# Altium project Project power supply.PrjPCB
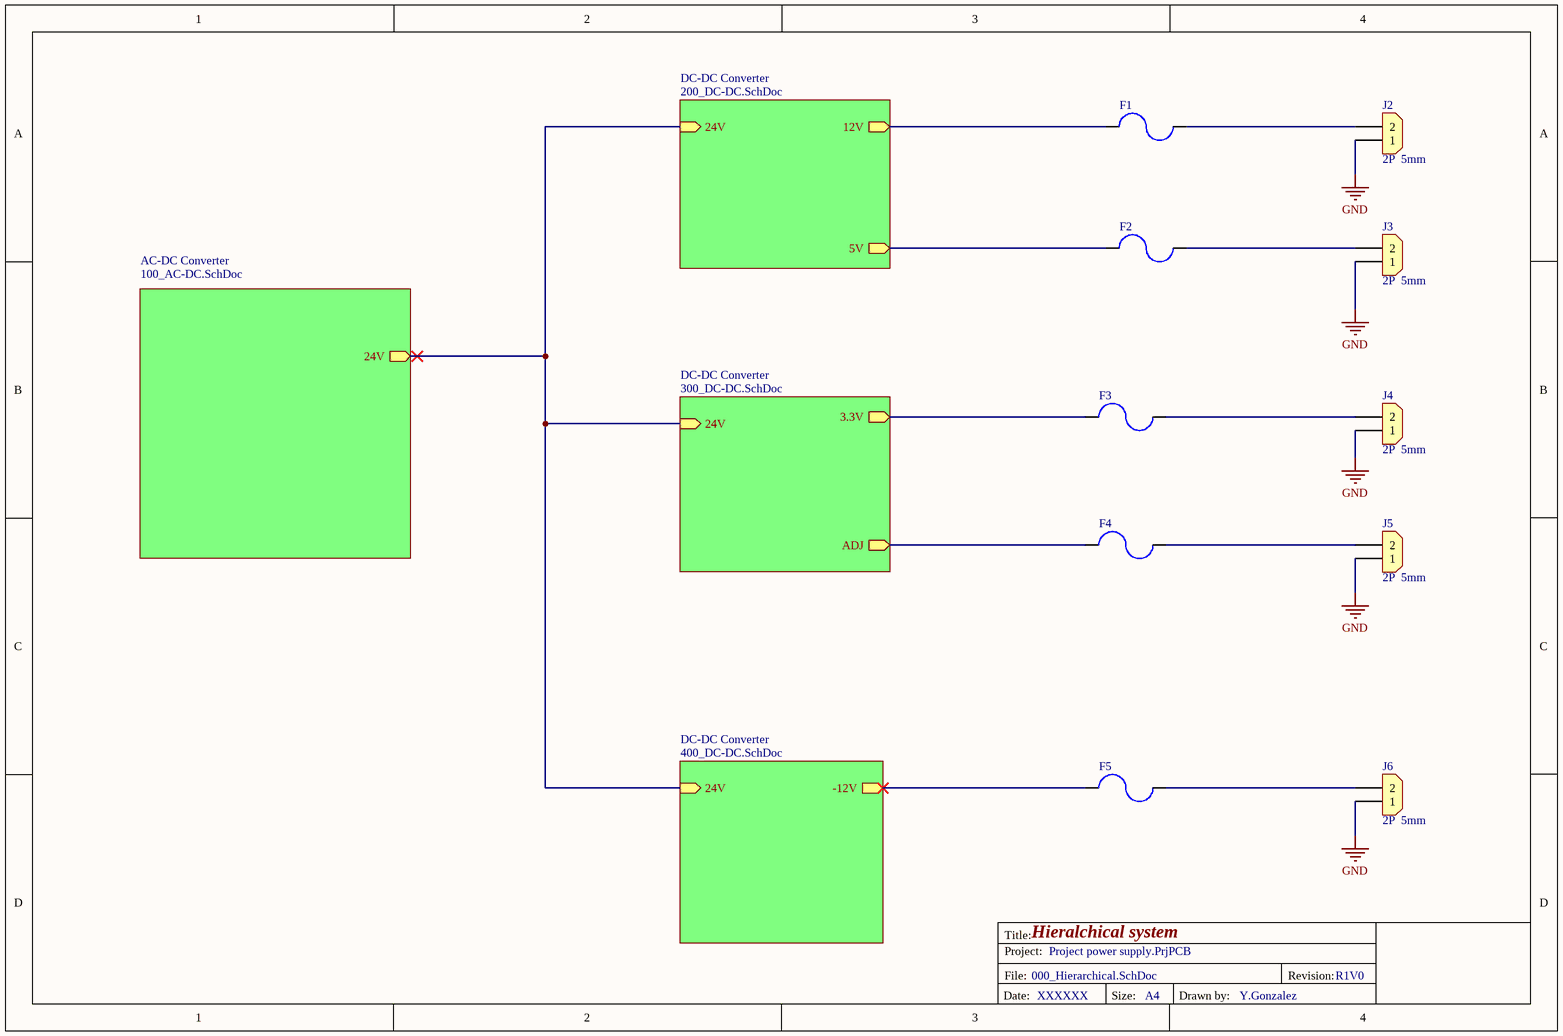
[diagram p0: 000_Hierarchical.SchDoc]
GlobalBoardName: boardname; GlobalDrawnBy: drawnby; GlobalFactory: pcbfactory; GlobalProjectName: projectname; GlobalReleaseDate: yyyymmdd; GlobalRevision: r; GlobalTPN: xxxxxx; GlobalVersion: v
5 sheets, 72 parts. Net scope: hierarchical (ports join the sheet entries above them; power ports are global).
Board file: Main_PCB_V1R0_XXXXXX.PcbDoc
Sheets:
  000_Hierarchical.SchDoc
    AC-DC Converter = 100_AC-DC.SchDoc
    DC-DC Converter = 200_DC-DC.SchDoc
    DC-DC Converter = 300_DC-DC.SchDoc
    DC-DC Converter = 400_DC-DC.SchDoc

## Sheet 000_Hierarchical.SchDoc: Hieralchical system
size A4; Date: XXXXXX; DrawnBy: Y.Gonzalez; Revision: R1V0; SheetNumber: 1; SheetTotal: 5

### Parts
F1  16V 5A  [FUSE_RADIAL_14.20X10.00X2.50mm]  (value not drawn)
F2  16V 5A  [FUSE_RADIAL_14.20X10.00X2.50mm]  (value not drawn)
F3  16V 4A  [FUSE_RADIAL_12.80X8.40X2.50mm]  (value not drawn)
F4  16V 4A  [FUSE_RADIAL_12.80X8.40X2.50mm]  (value not drawn)
F5  16V 1.6A  [1812]  (value not drawn)
J2  2P  5mm  [CON_2x1_TH_5mm]
J3  2P  5mm  [CON_2x1_TH_5mm]
J4  2P  5mm  [CON_2x1_TH_5mm]
J5  2P  5mm  [CON_2x1_TH_5mm]
J6  2P  5mm  [CON_2x1_TH_5mm]

### Sub-sheets
AC-DC Converter = 100_AC-DC.SchDoc: 24V (out)
DC-DC Converter = 200_DC-DC.SchDoc: 24V (in), 12V (out), 5V (out)
DC-DC Converter = 300_DC-DC.SchDoc: 24V (in), 3.3V (out), ADJ (out)
DC-DC Converter = 400_DC-DC.SchDoc: 24V (in), -12V (out)

### Nets
GND: J2.1 J3.1 J4.1 J5.1 J6.1
Net12V_1: F1.1 ; sheet DC-DC Converter/12V
Net24V_1: sheet AC-DC Converter/24V, sheet DC-DC Converter/24V, sheet DC-DC Converter/24V, sheet DC-DC Converter/24V
NetC11_1: F2.1 ; sheet DC-DC Converter/5V
NetC16_1: F3.1 ; sheet DC-DC Converter/3.3V
NetC20_1: F4.1 ; sheet DC-DC Converter/ADJ
NetC26_2: F5.1 ; sheet DC-DC Converter/-12V
NetF1_2: F1.2 J2.2
NetF2_2: F2.2 J3.2
NetF3_2: F3.2 J4.2
NetF4_2: F4.2 J5.2
NetF5_2: F5.2 J6.2

### Notes on the sheet
- Title:
- Project:
- File:
- Revision:
- Date:
- Size:
- A4
- Drawn by:

### Library data of the parts
F1 F2 = F_5A_16V_PTC: PTC RESET FUSE 16V 5A RADIAL; Manufacturer: Littelfuse Inc.; Manufacturer Part Number: RGEF500; Reel Sotck: N/A; Last modified by: J.Jaramillo; Last modified date: 20240309; Supplier 1: Digi-Key; Supplier Part Number 1: RGEF500HF-ND; ComponentLink1Description: Digi-key; ComponentLink1URL: https://www.digikey.com/product-detail/en/littelfuse-inc/RGEF500/RGEF500HF-ND/5029781
F3 F4 = F_4A_16V_PTC: PTC RESET FUSE 16V 4A RADIAL; Manufacturer: Littelfuse Inc.; Manufacturer Part Number: RGEF400; Reel Sotck: N/A; Last modified by: J.Jaramillo; Last modified date: 20240309; Supplier 1: Digi-Key; Supplier Part Number 1: RGEF400HF-ND; ComponentLink1Description: Digi-key; ComponentLink1URL: https://www.digikey.com/product-detail/en/littelfuse-inc/RGEF400/RGEF400HF-ND/5130245
F5 = F_1.6A_16V_PTC: PTC RESET FUSE 16V 1.6A 1812; Manufacturer: Bel Fuse Inc.; Manufacturer Part Number: 0ZCG0160BF2C; Supplier 1: Digi-Key; Supplier Part Number 1: 507-1776-1-ND; Reel Sotck: N/A; Last modified by: J.Jaramillo; Last modified date: 20240309; ComponentLink1Description: Digi-Key; ComponentLink1URL: https://www.digikey.com/product-detail/en/bel-fuse-inc/0ZCG0160BF2C/507-1776-1-ND/4156320
J2-J6 = Con_2x1_TH_5mm: TERM BLK 2POS SIDE ENTRY 5MM PCB; Manufacturer: Phoenix Contact; Manufacturer Part Number: 1935161; Supplier Part Number 1: 277-1667-ND; Last modified by: J.Jaramillo; Last modified date: 20240310; ComponentLink1Description: Digi-key; ComponentLink1URL: https://www.digikey.com/en/products/detail/phoenix-contact/1935161/568614; Reel Stock: N/A; Supplier 1: Digi-Key

## Sheet 100_AC-DC.SchDoc: AC-DC convertion stage
size A4; Date: XXXXXX; Author: Y.Gonzalez; Revision: R1V0; SheetNumber: 2; SheetTotal: 5
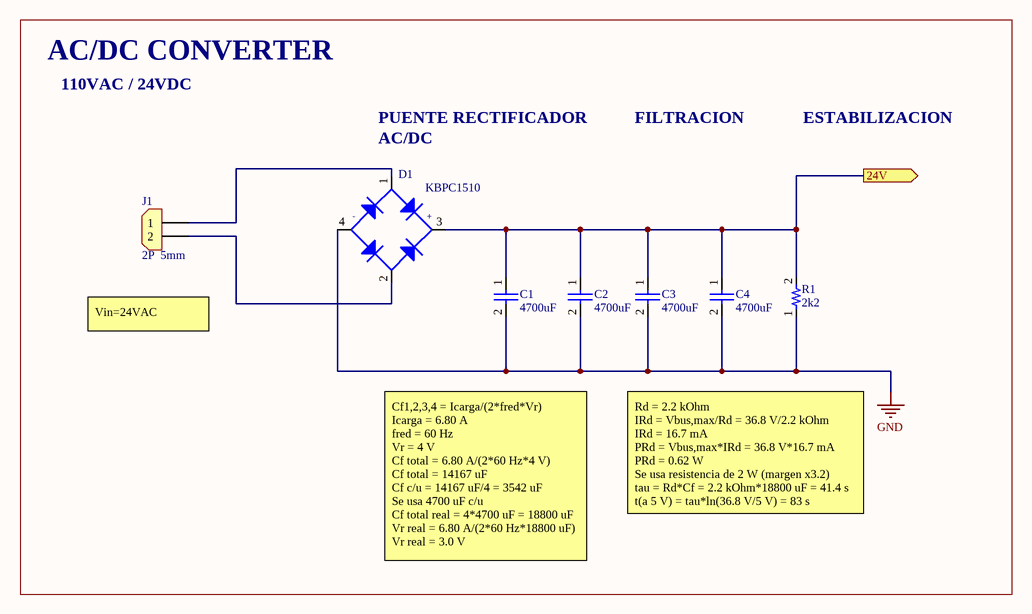
[diagram p1: 100_AC-DC.SchDoc]

### Parts
C1  value 4700uF  [CAP_4700uF_50V]  (hidden comment: 50USC4700MEFCSN22X35)
C2  value 4700uF  [CAP_4700uF_50V]  (hidden comment: 50USC4700MEFCSN22X35)
C3  value 4700uF  [CAP_4700uF_50V]  (hidden comment: 50USC4700MEFCSN22X35)
C4  value 4700uF  [CAP_4700uF_50V]  (hidden comment: 50USC4700MEFCSN22X35)
D1  KBPC1510  [KBPC8]
J1  2P  5mm  [CON_2x1_TH_5mm]
R1  value 2k2  [Res_2K2_2W_TH]

### Ports
24V (out)

### Nets
GND: C1.2 C2.2 C3.2 C4.2 D1.4 R1.1
Net24V_1: C1.1 C2.1 C3.1 C4.1 D1.3 R1.2 ; port 24V
NetD1_1: D1.1 J1.1
NetD1_2: D1.2 J1.2

### Notes on the sheet
- AC/DC CONVERTER
- 110VAC / 24VDC
- PUENTE RECTIFICADOR
- (near D1) AC/DC
- FILTRACION
- ESTABILIZACION
- Vin=24VAC
- Cf1,2,3,4 = Icarga/(2*fred*Vr)
  Icarga = 6.80 A
  fred = 60 Hz
  Vr = 4 V
  Cf total = 6.80 A/(2*60 Hz*4 V)
  Cf total = 14167 uF
  Cf c/u = 14167 uF/4 = 3542 uF
  Se usa 4700 uF c/u
  Cf total real = 4*4700 uF = 18800 uF
  Vr real = 6.80 A/(2*60 Hz*18800 uF)
  Vr real = 3.0 V
- Rd = 2.2 kOhm
  IRd = Vbus,max/Rd = 36.8 V/2.2 kOhm
  IRd = 16.7 mA
  PRd = Vbus,max*IRd = 36.8 V*16.7 mA
  PRd = 0.62 W
  Se usa resistencia de 2 W (margen x3.2)
  tau = Rd*Cf = 2.2 kOhm*18800 uF = 41.4 s
  t(a 5 V) = tau*ln(36.8 V/5 V) = 83 s
- Title:
- Project:
- File:
- Revision:
- Date:
- Size:
- A4
- Drawn by:
- (in symbol BR_KBPC_1kV_15A) -; +

### Library data of the parts
C1-C4 = CAP_4700uF_50V: CAP ALUM 4700uF ±20% 50V TH; Manufacturer: Rubycon; Parameter 4: C338224; Manufacturer Part Number: 50USC4700MEFCSN22X35; Supplier 1: LCSC; Supplier Part Number 1: C338224; Last modified by: Y.Gonzalez; Last modified date: 24102026; ComponentLink1Description: datasheet; ComponentLink1URL: https://www.lcsc.com/datasheet/C338224.pdf; ComponentLink2Description: LCSC; ComponentLink2URL: https://www.lcsc.com/product-detail/C338224.html?s_z=n_q_t_4700%25C2%25B5F%2520%252050V
D1 = BR_KBPC_1kV_15A: BRIDGE RECT 1kV 15A KBPC; Manufacturer: YFW; Supplier 1: C19273102; Supplier Part Number 1: LCSC; Manufacturer Part Numbers: KBPC1510; Last modified by: Y.Gonzalez; Last modified date: 24102026; ComponentLink1Description: LCSC; ComponentLink1URL: https://www.lcsc.com/product-detail/C19273102.html?s_z=n_q_KBPC1510; ComponentLink2Description: DATASHEET; ComponentLink2URL: https://www.lcsc.com/datasheet/C19273102.pdf
J1 = Con_2x1_TH_5mm: as J2 on sheet 000_Hierarchical; Supplier Part Number 1: 277-1667-ND; Last modified by: J.Jaramillo; Last modified date: 20240310; ComponentLink1Description: Digi-key; ComponentLink1URL: https://www.digikey.com/en/products/detail/phoenix-contact/1935161/568614; Reel Stock: N/A; Supplier 1: Digi-Key
R1 = Res_2K2_2W_TH: RES 2.2kΩ ±5% 2W Through Hole,D4.5xL11mm; Manufacturer: SEI(Stackpole Electronics Inc.); Manucfacturer Part Number 1: RSMF2JT2K20; Supplier: LCSC; Last modified by: Y.Gonzalez; Supplier Part Number 1: C2584336; Parameter 6: *; ComponentLink1Description: Datasheet; ComponentLink1URL: https://datasheet.octopart.com/RSMF2JT2K20-Stackpole-Electronics-datasheet-170576583.pdf; ComponentLink2Description: Ultralibrarian; ComponentLink2URL: https://app.ultralibrarian.com/details/3be72d1d-bf55-11e9-ab3a-0a3560a4cccc/Stackpole-International/RSMF2JT2K20?uid=19230567&exports=41; Last modified date: 25102026

## Sheet 200_DC-DC.SchDoc: DC-DC Convertion stage
size A4; Date: XXXXXX; Author: Y.Gonzalez; Revision: R1V0; SheetNumber: 3; SheetTotal: 5
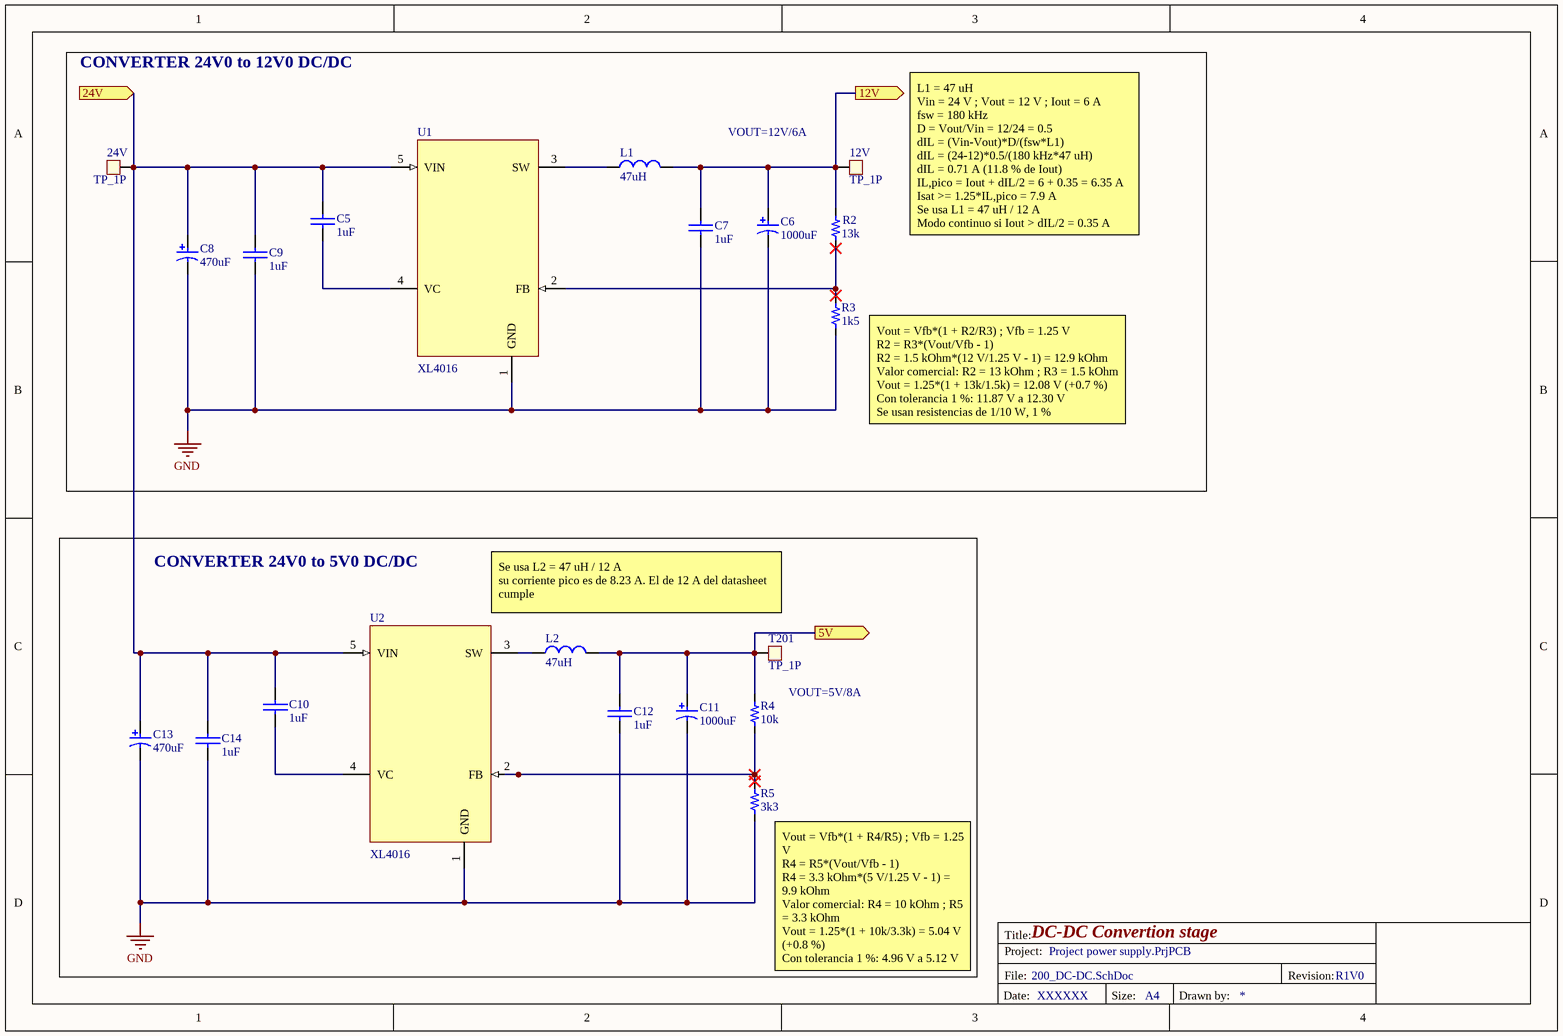
[diagram p2: 200_DC-DC.SchDoc]

### Parts
12V  TP_1P  [TP_TH_30mil]  (no BOM)
24V  TP_1P  [TP_TH_30mil]  (no BOM)
C5  value 1uF  [1206]  (hidden comment: 1uF 100V)
C6  value 1000uF  [RADIAL-CAN_LSx5mm_Diax10mm_Hx14mm]  (hidden comment: 1000uF 25V)
C7  value 1uF  [0805]  (hidden comment: 1uF 25V)
C8  value 470uF  [RADIAL-CAN-SMD_DIAX8MM_HX10MM]  (hidden comment: 470uF 10V)
C9  value 1uF  [1206]  (hidden comment: 1uF 100V)
C10  value 1uF  [1206]  (hidden comment: 1uF 100V)
C11  value 1000uF  [RADIAL-CAN_LSx5mm_Diax10mm_Hx14mm]  (hidden comment: 1000uF 25V)
C12  value 1uF  [0805]  (hidden comment: 1uF 25V)
C13  value 470uF  [RADIAL-CAN-SMD_DIAX8MM_HX10MM]  (hidden comment: 470uF 10V)
C14  value 1uF  [1206]  (hidden comment: 1uF 100V)
L1  value 47uH  [L_47uH_12A]  (hidden comment: FIXED IND 47UH 12A 12.2 MOHM SMD)
L2  value 47uH  [L_47uH_12A]  (hidden comment: FIXED IND 47UH 12A 12.2 MOHM SMD)
R2  value 13k  [0201]  (hidden comment: 13k 1/20W)
R3  value 1k5  [0402]  (hidden comment: 1k5 1/16W)
R4  value 10k  [0402]  (hidden comment: 10k 1/16W)
R5  value 3k3  [0402]  (hidden comment: 3k3 1/16W)
T201  TP_1P  [TP_TH_30mil]  (no BOM)
U1  XL4016  [TO-263-5]
U2  XL4016  [TO-263-5]

### Blocks framed on the sheet
CONVERTER 24V0 to 12V0 DC/DC: 12V 24V C5-C9 L1 R2 R3 U1
CONVERTER 24V0 to 5V0 DC/DC: C10-C14 L2 R4 R5 T201 U2

### Ports
5V (out), 12V (out), 24V (in)

### Nets
GND: C6.2 C7.2 C8.2 C9.2 C11.2 C12.2 C13.2 C14.2 R3.1 R5.1 U1.1(GND) U2.1(GND)
Net12V_1: 12V.1 C6.1 C7.1 L1.2 R2.2 ; port 12V
Net24V_1: 24V.1 C5.1 C8.1 C9.1 C10.1 C13.1 C14.1 U1.5(VIN) U2.5(VIN) ; port 24V
NetC5_2: C5.2 U1.4(VC)
NetC10_2: C10.2 U2.4(VC)
NetC11_1: C11.1 C12.1 L2.2 R4.2 T201.1 ; port 5V
NetL1_1: L1.1 U1.3(SW)
NetL2_1: L2.1 U2.3(SW)
NetR2_1: R2.1 R3.2 U1.2(FB)
NetR4_1: R4.1 R5.2 U2.2(FB)

### Notes on the sheet
- VOUT=12V/6A
- L1 = 47 uH
  Vin = 24 V ; Vout = 12 V ; Iout = 6 A
  fsw = 180 kHz
  D = Vout/Vin = 12/24 = 0.5
  dIL = (Vin-Vout)*D/(fsw*L1)
  dIL = (24-12)*0.5/(180 kHz*47 uH)
  dIL = 0.71 A (11.8 % de Iout)
  IL,pico = Iout + dIL/2 = 6 + 0.35 = 6.35 A
  Isat >= 1.25*IL,pico = 7.9 A
  Se usa L1 = 47 uH / 12 A
  Modo continuo si Iout > dIL/2 = 0.35 A
- (near R3) Vout = Vfb*(1 + R2/R3) ; Vfb = 1.25 V
  R2 = R3*(Vout/Vfb - 1)
  R2 = 1.5 kOhm*(12 V/1.25 V - 1) = 12.9 kOhm
  Valor comercial: R2 = 13 kOhm ; R3 = 1.5 kOhm
  Vout = 1.25*(1 + 13k/1.5k) = 12.08 V (+0.7 %)
  Con tolerancia 1 %: 11.87 V a 12.30 V
  Se usan resistencias de 1/10 W, 1 %
- Se usa L2 = 47 uH / 12 A
  su corriente pico es de 8.23 A. El de 12 A del datasheet cumple
- VOUT=5V/8A
- (near R5) Vout = Vfb*(1 + R4/R5) ; Vfb = 1.25 V
  R4 = R5*(Vout/Vfb - 1)
  R4 = 3.3 kOhm*(5 V/1.25 V - 1) = 9.9 kOhm
  Valor comercial: R4 = 10 kOhm ; R5 = 3.3 kOhm
  Vout = 1.25*(1 + 10k/3.3k) = 5.04 V (+0.8 %)
  Con tolerancia 1 %: 4.96 V a 5.12 V
  Se usan resistencias de 1/10 W, 1 %
- Title:
- Project:
- File:
- Revision:
- Date:
- Size:
- A4
- Drawn by:

### Library data of the parts
12V 24V T201 = TP_TH_30mil: Test point 30mil hole size; Last modified by: J.Jaramillo; Last modified date: 20240310
C5 C9 C10 C14 = Cap_1uF_1206_100V: CAP CER 1UF 100V X7R 1206; Manufacturer: Samsung Electro-Mechanics; Manufacturer Part Number: CL31B105KCHSNNE; Supplier 1: Digi-Key; Supplier Part Number 1: 1276-2747-1-ND; Last modified by: J.Jaramillo; Last modified date: 20240309; ComponentLink1Description: Digi-Key; ComponentLink1URL: https://www.digikey.com/en/products/detail/samsung-electro-mechanics/CL31B105KCHSNNE/3888405
C6 C11 = Cap_1000uF_25V_ALU_THT: CAP 1000uf/25V,10*16,105℃ RADIAL; Manufacturer: SamXon; Manufacturer Part Number: KM 1000U/25V; Last modified by: J.Jaramillo; Last modified date: 20240309; Supplier 1: Poshton; Supplier Part Number 1: KM 1000U/25V
C7 C12 = Cap_1uF_0805_25V: CAP CER 1UF 25V X7R 0805; Manufacturer: Yageo; Manufacturer Part Number: CC0805KKX7R8BB105; Supplier 1: Digi-Key; Supplier Part Number 1: 311-1456-1-ND; Last modified by: J.Jaramillo; Last modified date: 20240309; ComponentLink1Description: Digi-Key; ComponentLink1URL: https://www.digikey.com/product-detail/en/yageo/CC0805KKX7R8BB105/311-1456-1-ND/2833762
C8 C13 = Cap_470uF_10V_ALU_SMD: 470uF 10V ±20% SMD,D8xL10mm Aluminum Electrolytic Capacitors; Manufacturer: Lelon; Manufacturer Part Number: VZH471M1ATT-0810L; Supplier 1: LCSC; Supplier Part Number 1: C723180; Last modified by: J.Jaramillo; Last modified date: 20240309; ComponentLink1Description: LCSC; ComponentLink1URL: https://lcsc.com/product-detail/Aluminum-Electrolytic-Capacitors-SMD_Lelon-VZH471M1ATT-0810L_C723180.html
L1 L2 = L_47uH_12A: Manufacturer: Würth Elektronik; Manufacturer Part Number: 7443634700; Supplier 1: Digi-Key; Supplier Part Number 1: 732-2525-1-ND; Reel Stock: N/A; Last modified by: Y.Gonzalez; Last modified date: 23102026
R2 = Res_13k_0201_1/20W: RES SMD 13K OHM 1% 1/20W 0201; Manufacturer: YAGEO; Manufacturer Part Number: AC0201FR-0713KL; Supplier 1: DIGI-KEY; Supplier Part Number 1: YAG5154CT-ND; Reel Stock: N/A; Last modified by: J.Jaramillo; Last modified date: 20240310; ComponentLink1Description: Digi-Key; ComponentLink1URL: https://www.digikey.com/en/products/detail/yageo/AC0201FR-0713KL/5894273?s=N4IgTCBcDaIJoEEDiBWAjCgLAYQCoFoA5AERAF0BfIA
R3 = Res_1K5_0402_1/16W: RES SMD 1.5K OHM 5% 1/16W 0402; Manufacturer: Yageo; Manufacturer Part Number: RC0402JR-071K5L; Supplier 1: Digi-Key; Supplier Part Number 1: 311-1.5KJRCT-ND; Reel Stock: N/A; Last modified by: J.Jaramillo; Last modified date: 20240310; ComponentLink1Description: Link; ComponentLink1URL: https://www.digikey.com/product-detail/en/yageo/RC0402JR-071K5L/311-1-5KJRCT-ND/729359
R4 = Res_10k_0402_1/16W: RES SMD 10K OHM 1% 1/16W 0402; Manufacturer: Yageo; Manufacturer Part Number: RC0402FR-0710KL; Supplier 1: Digi-Key; Supplier Part Number 1: 311-10.0KLRCT-ND; Reel Stock: N/A; Last modified by: J.Jaramillo; Last modified date: 20240310; ComponentLink1Description: Digi-Key; ComponentLink1URL: https://www.digikey.com/en/products/detail/yageo/RC0402FR-0710KL/726523?s=N4IgTCBcDaIEoGEAMAWJYBicC0SDsAjEgNIAyIAugL5A
R5 = Res_3k3_0402_1/16W: RES SMD 3.3K OHM 5% 1/16W 0402; Manufacturer: Yageo; Manufacturer Part Number: RC0402JR-073K3L; Supplier 1: Digi-Key; Supplier Part Number 1: 311-3.3KJRCT-ND; Reel Stock: N/A; Last modified by: J.Jaramillo; Last modified date: 20240310; ComponentLink1Description: Digi-Key; ComponentLink1URL: https://www.digikey.com/product-detail/en/yageo/RC0402JR-073K3L/311-3-3KJRCT-ND/729403
U1 U2 = DCDC_ADJ_12A_TO-220-5L: 180 KHz fixed frequency PWM buck (step-down) DC/DC converter, capable of driving a 12A load with high efficiency; Manufacturer: XLSEMI; Manufacturer Part Number: XL4016; Supplier 1: LCSC; Supplier Part Number 1: C55881; Reel Stock: N/A; Last modified by: Y.Gonzalez; Last modified date: 22102026; ComponentLink1Description: LCSC; ComponentLink1URL: https://www.lcsc.com/product-detail/C55881.html; ComponentLink2Description: Datasheet; ComponentLink2URL: https://www.snapeda.com/parts/XL4016/XLSEMI/datasheet/

## Sheet 300_DC-DC.SchDoc: DC-DC Convertion stage
size A4; Date: XXXXXX; Author: Y.Gonzalez; Revision: R1V0; SheetNumber: 4; SheetTotal: 5
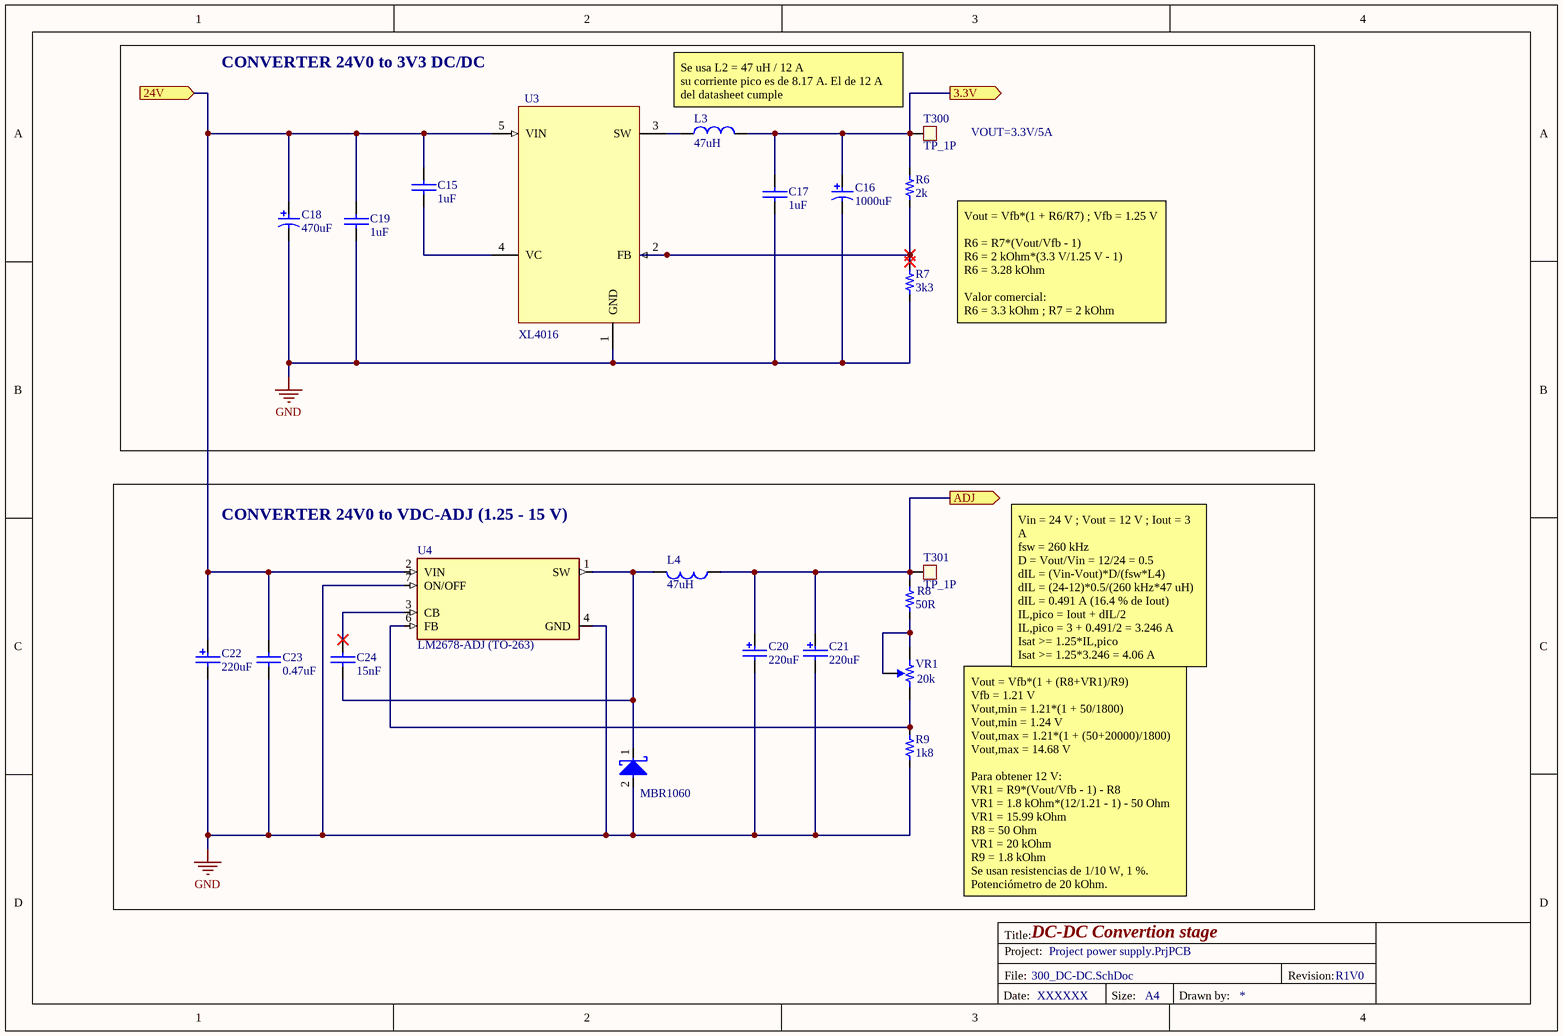
[diagram p3: 300_DC-DC.SchDoc]

### Parts
C15  value 1uF  [1206]  (hidden comment: 1uF 100V)
C16  value 1000uF  [RADIAL-CAN_LSx5mm_Diax10mm_Hx14mm]  (hidden comment: 1000uF 25V)
C17  value 1uF  [0805]  (hidden comment: 1uF 25V)
C18  value 470uF  [RADIAL-CAN-SMD_DIAX8MM_HX10MM]  (hidden comment: 470uF 10V)
C19  value 1uF  [1206]  (hidden comment: 1uF 100V)
C20  value 220uF  [RADIAL-CAN-SMD_Diax8mm_Hx10.2mm]  (hidden comment: 220uF 35V)
C21  value 220uF  [RADIAL-CAN-SMD_Diax8mm_Hx10.2mm]  (hidden comment: 220uF 35V)
C22  value 220uF  [RADIAL-CAN-SMD_Diax8mm_Hx10.2mm]  (hidden comment: 220uF 50V)
C23  value 0.47uF  [0603]  (hidden comment: 0.47uF_50v)
C24  value 15nF  [0603_1.4mm]  (hidden comment: 15nF 50V)
D2  MBR1060  [D_Schottky_60V_10A_TO]
L3  value 47uH  [L_47uH_12A]  (hidden comment: FIXED IND 47UH 12A 12.2 MOHM SMD)
L4  value 47uH  [L_47uH_12A]  (hidden comment: FIXED IND 47UH 12A 12.2 MOHM SMD)
R6  value 2k  [0201]  (hidden comment: 2k 1/20W)
R7  value 3k3  [0402]  (hidden comment: 3k3 1/16W)
R8  value 50R  [0603]  (hidden comment: 50R 1/18W)
R9  value 1k8  [0603]  (hidden comment: 1k8 1/10W)
T300  TP_1P  [TP_TH_30mil]  (no BOM)
T301  TP_1P  [TP_TH_30mil]  (no BOM)
U3  XL4016  [TO-263-5]
U4  LM2678-ADJ (TO-263)  [DCDC_ADJ_5A_TO263-7]
VR1  value 20k  [Pot_3x1_2.54mm_TH_TM]  (hidden comment: 20k 1/2W)

### Blocks framed on the sheet
CONVERTER 24V0 to 3V3 DC/DC: C15-C19 L3 R6 R7 T300 U3
CONVERTER 24V0 to VDC-ADJ (1.25 - 15 V): C20-C24 D2 L4 R8 R9 T301 U4 VR1

### Ports
3.3V (out), 24V (in), ADJ (out)

### Nets
GND: C16.2 C17.2 C18.2 C19.2 C20.2 C21.2 C22.2 C23.2 D2.2 R7.1 R9.1 U3.1(GND) U4.4(GND) U4.7(ON/OFF)
Net24V_1: C15.1 C18.1 C19.1 C22.1 C23.1 U3.5(VIN) U4.2(VIN) ; port 24V
NetC15_2: C15.2 U3.4(VC)
NetC16_1: C16.1 C17.1 L3.2 R6.2 T300.1 ; port 3.3V
NetC20_1: C20.1 C21.1 L4.1 R8.2 T301.1 ; port ADJ
NetC24_1: C24.1 U4.3(CB)
NetC24_2: C24.2 D2.1 L4.2 U4.1(SW)
NetL3_1: L3.1 U3.3(SW)
NetR6_1: R6.1 R7.2 U3.2(FB)
NetR8_1: R8.1 VR1.2 VR1.3
NetR9_2: R9.2 U4.6(FB) VR1.1

### Notes on the sheet
- Se usa L2 = 47 uH / 12 A
  su corriente pico es de 8.17 A. El de 12 A del datasheet cumple
- VOUT=3.3V/5A
- Vout = Vfb*(1 + R6/R7) ; Vfb = 1.25 V
  R6 = R7*(Vout/Vfb - 1)
  R6 = 2 kOhm*(3.3 V/1.25 V - 1)
  R6 = 3.28 kOhm
  Valor comercial:
  R6 = 3.3 kOhm ; R7 = 2 kOhm
  Vout = 1.25*(1 + 3.3k/2k)
  Vout = 3.31 V (0.38 %)
  Con tolerancia 1 %:
  Vout = 3.28 V a 3.34 V
  Se usan resistencias de 1/10 W, 1 %.
- Vin = 24 V ; Vout = 12 V ; Iout = 3 A
  fsw = 260 kHz
  D = Vout/Vin = 12/24 = 0.5
  dIL = (Vin-Vout)*D/(fsw*L4)
  dIL = (24-12)*0.5/(260 kHz*47 uH)
  dIL = 0.491 A (16.4 % de Iout)
  IL,pico = Iout + dIL/2
  IL,pico = 3 + 0.491/2 = 3.246 A
  Isat >= 1.25*IL,pico
  Isat >= 1.25*3.246 = 4.06 A
  Se usa L4 = 47 uH / 5 A
- Vout = Vfb*(1 + (R8+VR1)/R9)
  Vfb = 1.21 V
  Vout,min = 1.21*(1 + 50/1800)
  Vout,min = 1.24 V
  Vout,max = 1.21*(1 + (50+20000)/1800)
  Vout,max = 14.68 V
  Para obtener 12 V:
  VR1 = R9*(Vout/Vfb - 1) - R8
  VR1 = 1.8 kOhm*(12/1.21 - 1) - 50 Ohm
  VR1 = 15.99 kOhm
  R8 = 50 Ohm
  VR1 = 20 kOhm
  R9 = 1.8 kOhm
  Se usan resistencias de 1/10 W, 1 %.
  Potenciómetro de 20 kOhm.
- Title:
- Project:
- File:
- Revision:
- Date:
- Size:
- A4
- Drawn by:

### Library data of the parts
C15 C19 = Cap_1uF_1206_100V: as C5 on sheet 200_DC-DC; Supplier 1: Digi-Key; Supplier Part Number 1: 1276-2747-1-ND; Last modified by: J.Jaramillo; Last modified date: 20240309; ComponentLink1Description: Digi-Key; ComponentLink1URL: https://www.digikey.com/en/products/detail/samsung-electro-mechanics/CL31B105KCHSNNE/3888405
C16 = Cap_1000uF_25V_ALU_THT: as C6 on sheet 200_DC-DC; Last modified by: J.Jaramillo; Last modified date: 20240309; Supplier 1: Poshton; Supplier Part Number 1: KM 1000U/25V
C17 = Cap_1uF_0805_25V: as C7 on sheet 200_DC-DC; Supplier 1: Digi-Key; Supplier Part Number 1: 311-1456-1-ND; Last modified by: J.Jaramillo; Last modified date: 20240309; ComponentLink1Description: Digi-Key; ComponentLink1URL: https://www.digikey.com/product-detail/en/yageo/CC0805KKX7R8BB105/311-1456-1-ND/2833762
C18 = Cap_470uF_10V_ALU_SMD: as C8 on sheet 200_DC-DC; Supplier 1: LCSC; Supplier Part Number 1: C723180; Last modified by: J.Jaramillo; Last modified date: 20240309; ComponentLink1Description: LCSC; ComponentLink1URL: https://lcsc.com/product-detail/Aluminum-Electrolytic-Capacitors-SMD_Lelon-VZH471M1ATT-0810L_C723180.html
C20 C21 = Cap_220uF_35V_ALU_SMD: CAP ALUM 220UF 20% 35V SMD; Manufacturer: Panasonic Electronic Components; Manufacturer Part Number: EEE-1VA221UP; Supplier 1: Digi-Key; Supplier Part Number 1: PCE3955CT-ND; Reel stock: N/A; Last modified by: J.Jaramillo; Last modified date: 20240309; ComponentLink1Description: Digi-Key; ComponentLink1URL: https://www.digikey.com/products/en?keywords=PCE3955CT-ND
C22 = Cap_220uF_50V_ALU_SMD: CAP ALUM 220UF 20% 50V SMD; Manufacturer: Panasonic; Manufacturer Part Number: EEE-FT1H221AP; Supplier 1: Mouser; Supplier Part Number 1: 667-EEE-FT1H221AP; Reel stock: N/A; Last modified by: J.Jaramillo; Last modified date: 20240309; ComponentLink1Description: Mouser; ComponentLink1URL: https://www.mouser.com/ProductDetail/Panasonic/EEE-FT1H221AP?qs=CMJjuEs1%252BuFFGBuxQbDfDA==
C23 = Cap_0.47uF_0603_50V: CAP CER 0.47UF 50V X5R 0603; Manufacturer: Taiyo Yuden; Manufacturer Part Number: UMK107ABJ474KA-T; Supplier 1: Digi-Key; Supplier Part Number 1: 587-3171-1-ND; Last modified by: J.Jaramillo; Last modified date: 20240309; ComponentLink1Description: Digi-Key; ComponentLink1URL: https://www.digikey.com/en/products/detail/taiyo-yuden/UMK107ABJ474KA-T/3194980?s=N4IgTCBcDaIKwA4DsBaAzARiRlOByAIgAQgC6AvkA
C24 = Cap_0.015uF_0603_50V: CAP CER 0.015UF 50V X7R 0603; Manufacturer: Samsung Electro-Mechanics; Manufacturer Part Number: CL10B153KB8NNNC; Supplier 1: Digi-Key; Supplier Part Number 1: 1276-1277-1-ND; Last modified by: J.Jaramillo; Last modified date: 20240309; ComponentLink1Description: Digi-Key; ComponentLink1URL: https://www.digikey.com/en/products/detail/samsung-electro-mechanics/CL10B153KB8NNNC/3886935?s=N4IgTCBcDaIMIBkCMAGAQkgrAZgNJoA4A5EuEAXQF8g
D2 = D_Schottky_60V_10A_TO: DIODE SCHOTTKY 60V TO-220AC-2; Manufacturer: SMC; Manufacturer Part Number 1: MBR1060; Supplier: LCSC; Supplier Part Number 1: C260256; Last modified date: 25102026; Last modified by: Y.Gonzalez; ComponentLink1Description: LCSC; ComponentLink1URL: https://www.lcsc.com/product-detail/C260256.html?s_z=n_q_x_MBR1060; ComponentLink2Description: Datasheet; ComponentLink2URL: https://www.lcsc.com/datasheet/C260256.pdf; Value: 60V
L3 L4 = L_47uH_12A: as L1 on sheet 200_DC-DC; Supplier 1: Digi-Key; Supplier Part Number 1: 732-2525-1-ND; Reel Stock: N/A; Last modified by: Y.Gonzalez; Last modified date: 23102026
R6 = Res_2k_0201_1/20W: RES SMD 2K OHM 1% 1/20W 0201; Manufacturer: Vishay Dale; Manufacturer Part Number: CRCW02012K00FNED; Supplier 1: Digi-Key; Supplier Part Number 1: 541-2.00KABCT-ND; Reel Stock: N/A; Last modified by: J.Jaramillo; Last modified date: 20240310; ComponentLink1Description: Digi-Key; ComponentLink1URL: https://www.digikey.com/en/products/detail/vishay-dale/CRCW02012K00FNED/1199840?s=N4IgTCBcDaIKwBYCMBaMA6ADJg0gQQCEBhAFRQDkAREAXQF8g
R7 = Res_3k3_0402_1/16W: as R5 on sheet 200_DC-DC; Supplier 1: Digi-Key; Supplier Part Number 1: 311-3.3KJRCT-ND; Reel Stock: N/A; Last modified by: J.Jaramillo; Last modified date: 20240310; ComponentLink1Description: Digi-Key; ComponentLink1URL: https://www.digikey.com/product-detail/en/yageo/RC0402JR-073K3L/311-3-3KJRCT-ND/729403
R8 = Res_50R_0603_1/18W: RES SMD 50 OHM 0.1% 1/8W 0603; Manufacturer: Vishay Thin Film; Manufacturer Part Number: FC0603E50R0BST1; Supplier 1: Digi-Key; Supplier Part Number 1: FC0603-50BWCT-ND; Reel Stock: N/A; Last modified by: J.Jaramillo; Last modified date: 20240310; ComponentLink1Description: Digi-Key; ComponentLink1URL: https://www.digikey.com/product-detail/en/vishay-thin-film/FC0603E50R0BST1/FC0603-50BWTR-ND/1769755
R9 = Res_1k8_0603_1/10W: RES 1.8K OHM 1% 1/10W 0603; Manufacturer: Stackpole Electronics Inc; Manufacturer Part Number: RMCF0603FT1K80; Supplier 1: Digi-Key; Supplier Part Number 1: RMCF0603FT1K80CT-ND; Reel Stock: N/A; Last modified by: J.Jaramillo; Last modified date: 20240310; ComponentLink1Description: Digi-Key; ComponentLink1URL: https://www.digikey.com/product-detail/en/stackpole-electronics-inc/RMCF0603FT1K80/RMCF0603FT1K80CT-ND/1943005
T300 T301 = TP_TH_30mil: Test point 30mil hole size; Last modified by: J.Jaramillo; Last modified date: 20240310
U3 = DCDC_ADJ_12A_TO-220-5L: as U1 on sheet 200_DC-DC; Manufacturer Part Number: XL4016; Supplier 1: LCSC; Supplier Part Number 1: C55881; Reel Stock: N/A; Last modified by: Y.Gonzalez; Last modified date: 22102026; ComponentLink1Description: LCSC; ComponentLink1URL: https://www.lcsc.com/product-detail/C55881.html; ComponentLink2Description: Datasheet; ComponentLink2URL: https://www.snapeda.com/parts/XL4016/XLSEMI/datasheet/
U4 = DCDC_ADJ_5A_TO263-7: IC REG BUCK ADJ 5A TO220-7; Manufacturer: Texas Instruments; Manufacturer Part Number: 296-43516-5-ND; Supplier 1: Digi-Key; Supplier Part Number 1: LM2678T-ADJ; Reel Stock: N/A; Last modified by: Y.Gonzalez; Last modified date: 23102026; ComponentLink1Description: DigiKey; ComponentLink1URL: https://www.digikey.com/es/products/detail/texas-instruments/LM2678T-ADJ/3695077; ComponentLink2Description: datasheet; ComponentLink2URL: https://www.ti.com/lit/ds/symlink/lm2678.pdf?HQS=dis-dk-null-digikeymode-dsf-pf-null-wwe&ts=1792805774583
VR1 = Pot_20k_1/2W_TH_TM: TRIMMER 20K OHM 0.5W PC PIN TOP; Manufacturer: Bourns Inc.; Manufacturer Part Number: 3296W-1-203LF; Reel Stock: N/A; Last modified by: J.Jaramillo; Last modified date: 20240310; Supplier 1: Digi-Key; Supplier Part Number 1: 3296W-203LF-ND

## Sheet 400_DC-DC.SchDoc: DC-DC Convertion stage
size A4; Date: XXXXXX; Author: Y.Gonzalez; Revision: R1V0; SheetNumber: 5; SheetTotal: 5
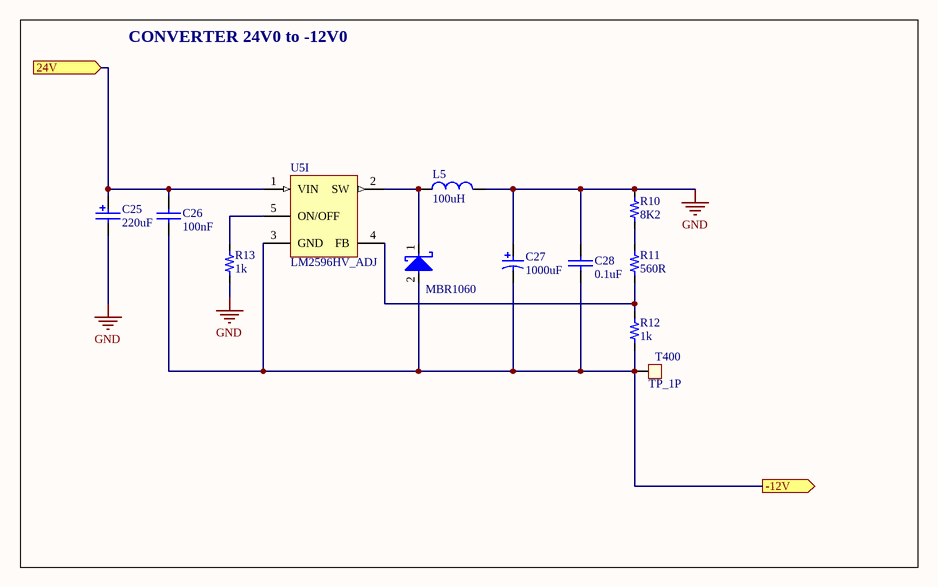
[diagram p4: 400_DC-DC.SchDoc]

### Parts
C25  value 220uF  [RADIAL-CAN-SMD_Diax8mm_Hx10.2mm]  (hidden comment: 220uF 50V)
C26  value 100nF  [1206]  (hidden comment: 100nF 100V)
C27  value 1000uF  [RADIAL-CAN_LSx5mm_Diax10mm_Hx14mm]  (hidden comment: 1000uF 25V)
C28  value 0.1uF  [0402_RF]  (hidden comment: 100nF 25V)
D3  MBR1060  [D_Schottky_60V_10A_TO]
L5  value 100uH  [L_2SMD_8x8.5x5MM_NS]  (hidden comment: 100uH 2.5A)
R10  value 8K2  [0603]  (hidden comment: 1/10W)
R11  value 560R  [0603]  (hidden comment: 560R 1/10W)
R12  value 1k  [0603]  (hidden comment: 1k 1/10W)
R13  value 1k  [0603]  (hidden comment: 1k 1/10W)
T400  TP_1P  [TP_TH_30mil]  (no BOM)
U5  LM2596HV_ADJ  [LM2596HVS-ADJ]  (part I of 9)

### Blocks framed on the sheet
CONVERTER 24V0 to -12V0: C25-C28 D3 L5 R10-R13 T400 U5

### Ports
24V (in), -12V (out)

### Nets
GND: C25.2 C27.1 C28.1 L5.2 R10.2 R13.1
Net24V_1: C25.1 C26.1 U5.1(VIN) ; port 24V
NetC26_2: C26.2 C27.2 C28.2 D3.2 R12.1 T400.1 U5.3(GND) ; port -12V
NetD3_1: D3.1 L5.1 U5.2(SW)
NetR10_1: R10.1 R11.2
NetR11_1: R11.1 R12.2 U5.4(FB)
NetR13_2: R13.2 U5.5(ON/OFF)

### Notes on the sheet
- Title:
- Project:
- File:
- Revision:
- Date:
- Size:
- A4
- Drawn by:

### Library data of the parts
C25 = Cap_220uF_50V_ALU_SMD: as C22 on sheet 300_DC-DC; Supplier 1: Mouser; Supplier Part Number 1: 667-EEE-FT1H221AP; Reel stock: N/A; Last modified by: J.Jaramillo; Last modified date: 20240309; ComponentLink1Description: Mouser; ComponentLink1URL: https://www.mouser.com/ProductDetail/Panasonic/EEE-FT1H221AP?qs=CMJjuEs1%252BuFFGBuxQbDfDA==
C26 = Cap_0.1uF_1206_100V: CAP CER 0.1UF 100V X7R 1206; Manufacturer: Samsung Electro-Mechanics; Manufacturer Part Number: CL31B104KCFNNNE; Supplier 1: Digi-Key; Supplier Part Number 1: 1276-1151-1-ND; Last modified by: J.Jaramillo; Last modified date: 20240309; ComponentLink1Description: Digi-Key; ComponentLink1URL: https://www.digikey.com/en/products/detail/samsung-electro-mechanics/CL31B104KCFNNNE/3886809
C27 = Cap_1000uF_25V_ALU_THT: as C6 on sheet 200_DC-DC; Last modified by: J.Jaramillo; Last modified date: 20240309; Supplier 1: Poshton; Supplier Part Number 1: KM 1000U/25V
C28 = Cap_0.1uF_0402_25V: CAP CER 0.1UF 25V X7R 0402; Manufacturer: Yageo; Manufacturer Part Number: CC0402KRX7R8BB104; Last modified by: J.Jaramillo; Last modified date: 20240309; ComponentLink1Description: Digi-key; ComponentLink1URL: https://www.digikey.com/products/en?keywords=311-2077-1-ND; Supplier 1: Digi-Key; Supplier Part Number 1: 311-2077-1-ND
D3 = D_Schottky_60V_10A_TO: as D2 on sheet 300_DC-DC; Manufacturer Part Number 1: MBR1060; Supplier: LCSC; Supplier Part Number 1: C260256; Last modified date: 25102026; Last modified by: Y.Gonzalez; ComponentLink1Description: LCSC; ComponentLink1URL: https://www.lcsc.com/product-detail/C260256.html?s_z=n_q_x_MBR1060; ComponentLink2Description: Datasheet; ComponentLink2URL: https://www.lcsc.com/datasheet/C260256.pdf; Value: 60V
L5 = L_100uH_2.5A_NS: 2.5A 100uH ±20% 3A SMD,8x8.5mm Power Inductors ROHS; Manufacturer: PROD Tech; Manufacturer Part Number: PSPMAA0805-101M-ANP; Supplier 1: LCSC; Supplier Part Number 1: C2962892; Reel Stock: N/A; Last modified by: J.Jaramillo; Last modified date: 20240310; ComponentLink1Description: Digi-Key; ComponentLink1URL: https://www.digikey.com/en/products/detail/bourns-inc/SRR1280-101M/2127044
R10 = Res_8k2_0603_1/10W: RES SMD 8.2K OHM 1% 1/10W 0603; Manufacturer: Yageo; Manufacturer Part Number: AC0603FR-078K2L; Reel Stock: N/A; Last modified by: J.Jaramillo; Last modified date: 20240310; ComponentLink1Description: Digi-Key; ComponentLink1URL: https://www.digikey.com/en/products/detail/yageo/AC0603FR-078K2L/5896322; Supplier 1: Digi-Key; Supplier Part Number 1: YAG3634CT-ND
R11 = Res_560R_0603_1/10W: RES SMD 560 OHM 1% 1/10W 0603; Manufacturer: Yageo; Manufacturer Part Number: RC0603FR-07560RL; ComponentLink1URL: https://www.digikey.com/product-detail/en/yageo/RC0603FR-07560RL/311-560HRCT-ND/730251; Reel Stock: N/A; Last modified by: J.Jaramillo; Last modified date: 20240310; ComponentLink1Description: Digi-key; Supplier Part Number 1: 311-560HRCT-ND; Supplier 1: Digi-Key
R12 R13 = Res_1k_0603_1/10W: RES SMD 1K OHM 1% 1/10W 0603; Manufacturer: Yageo; Manufacturer Part Number: RC0603FR-071KL; Supplier 1: Digi-Key; Supplier Part Number 1: 311-1.00KHRCT-ND; Reel Stock: N/A; Last modified by: J.Jaramillo; Last modified date: 20240310; ComponentLink1Description: Digi-Key; ComponentLink1URL: https://www.digikey.com/product-detail/en/yageo/RC0603FR-071KL/311-1-00KHRCT-ND/729790
T400 = TP_TH_30mil: Test point 30mil hole size; Last modified by: J.Jaramillo; Last modified date: 20240310
U5 = LDO_12V0_1A_TO263-5: 60V/3A/150kHz Step-Down Switching Regulator; Manufacturer: TECH PUBLIC; Manufacturer Part Number 1: LM2596HVS-ADJ; Supplier Part Number 1: C18221477; Supplier: LCSC; Last modified date: 29102026; Last modified by: Y.Gonzalez; ComponentLink1Description: Datasheet; ComponentLink1URL: https://www.lcsc.com/datasheet/C18221477.pdf; ComponentLink2Description: LCSC; ComponentLink2URL: https://www.lcsc.com/product-detail/C18221477.html?s_z=n_q_lm2596hv

## Nets that join several sheets
GND: 000_Hierarchical (5 pins), 100_AC-DC (6 pins), 200_DC-DC (12 pins), 300_DC-DC (14 pins), 400_DC-DC (6 pins)
Net12V_1: 000_Hierarchical (F1.1), 200_DC-DC (5 pins)
Net24V_1: 100_AC-DC (6 pins), 200_DC-DC (9 pins), 300_DC-DC (7 pins), 400_DC-DC (C25.1 C26.1 U5.1)
NetC11_1: 000_Hierarchical (F2.1), 200_DC-DC (5 pins)
NetC16_1: 000_Hierarchical (F3.1), 300_DC-DC (5 pins)
NetC20_1: 000_Hierarchical (F4.1), 300_DC-DC (5 pins)
NetC26_2: 000_Hierarchical (F5.1), 400_DC-DC (7 pins)